# Altium schematic sheet AC_sch.SchDoc
size A; Organization: ORGANIZATION; Address1: ADDRESS 1; Address2: ADDRESS 2; Address3: ADDRESS 3; Address4: ADDRESS 4; Revision: -; SheetNumber: 2; SheetTotal: 2; ENG_APP_DATE: --/--/--; DSN_APP_DATE: --/--/--; CHK_APP_DATE: --/--/--
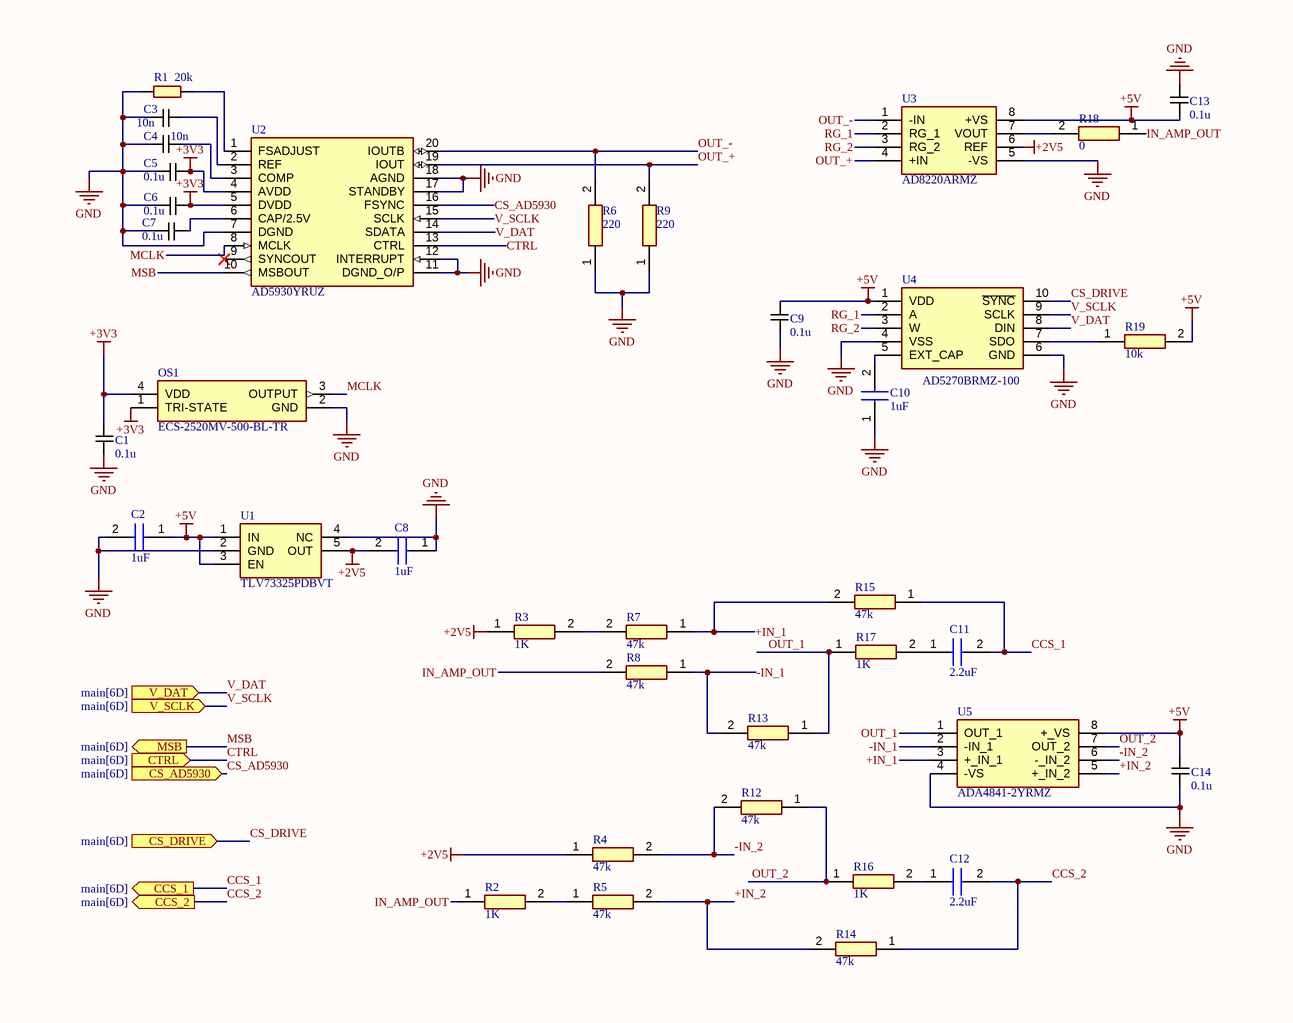
[diagram p0: AC_sch.SchDoc]

## Parts
C1  0.1u  [CAPC1005X55N]
C2  1uF  [CAPC1005X55N]
C3  10n  [CAPC1005X55N]
C4  10n  [CAPC1005X55N]
C5  0.1u  [CAPC1005X55N]
C6  0.1u  [CAPC1005X55N]
C7  0.1u  [CAPC1005X55N]
C8  1uF  [CAPC1005X55N]
C9  0.1u  [CAPC1005X55N]
C10  1uF  [CAPC1005X55N]
C11  2.2uF  [CAPC1005X57N]
C12  2.2uF  [CAPC1005X57N]
C13  0.1u  [CAPC1005X55N]
C14  0.1u  [CAPC1005X55N]
OS1  ECS-2520MV-500-BL-TR  [ECS2520MV500BLTR]
R1  20k  [RESC1005X40N]
R2  1K  [RESC1005X40N]
R3  1K  [RESC1005X40N]
R4  47k  [RESC1608X55N]
R5  47k  [RESC1608X55N]
R6  220  [RESC1005X40N]
R7  47k  [RESC1608X55N]
R8  47k  [RESC1608X55N]
R9  220  [RESC1005X40N]
R12  47k  [RESC1608X55N]
R13  47k  [RESC1608X55N]
R14  47k  [RESC1608X55N]
R15  47k  [RESC1608X55N]
R16  1K  [RESC1005X40N]
R17  1K  [RESC1005X40N]
R18  0  [RESC2012X65N]
R19  10k  [RESC1005X40N]
U1  TLV73325PDBVT  [SOT95P280X145-5N]
U2  AD5930YRUZ  [SOP65P640X120-20N]
U3  AD8220ARMZ  [SOP65P490X110-8N]
U4  AD5270BRMZ-100  [SOP50P490X110-10N]
U5  ADA4841-2YRMZ  [SOP65P490X110-8N]

## Ports
CCS_1 (out, see main[6D]), CCS_2 (out, see main[6D]), CS_AD5930 (in, see main[6D]), CS_DRIVE (in, see main[6D]), CTRL (in, see main[6D]), MSB (out, see main[6D]), V_DAT (in, see main[6D]), V_SCLK (in, see main[6D])

## Nets
+2V5: C8.2 R3.1 R4.1 U1.5(OUT) U3.6(REF)
+3V3: C1.2 C5.2 C6.2 OS1.1(TRI-STATE) OS1.4(VDD) U2.4(AVDD) U2.5(DVDD)
+5V: C2.1 C9.1 C13.2 C14.2 R19.2 U1.1(IN) U1.3(EN) U3.8(+VS) U4.1(VDD) U5.8(+_VS)
GND: C1.1 C2.2 C3.1 C4.2 C5.1 C6.1 C7.1 C8.1 C9.2 C10.1 C13.1 C14.1 OS1.2(GND) R1.1 R6.1 R9.1 U1.2(GND) U1.4(NC) U2.7(DGND) U2.11(DGND_O/P) U2.12(INTERRUPT) U2.17(STANDBY) U2.18(AGND) U3.5(-VS) U4.4(VSS) U4.6(GND) U5.4(-VS)
+IN_1: R7.1 R15.2 U5.3(+_IN_1)
+IN_2: R5.2 R14.2 U5.5(+_IN_2)
-IN_1: R8.1 R13.2 U5.2(-IN_1)
-IN_2: R4.2 R12.2 U5.6(-_IN_2)
CCS_1: C11.2 R15.1 ; port CCS_1
CCS_2: C12.2 R14.1 ; port CCS_2
CS_AD5930: U2.16(FSYNC) ; port CS_AD5930
CS_DRIVE: U4.10(~{SYNC}) ; port CS_DRIVE
CTRL: U2.13(CTRL) ; port CTRL
IN_AMP_OUT: R2.1 R8.2 R18.1
MCLK: OS1.3(OUTPUT) U2.8(MCLK)
MSB: U2.10(MSBOUT) ; port MSB
OUT_1: R13.1 R17.1 U5.1(OUT_1)
OUT_2: R12.1 R16.1 U5.7(OUT_2)
OUT_+: R9.2 U2.19(IOUT) U3.4(+IN)
OUT_-: R6.2 U2.20(IOUTB) U3.1(-IN)
RG_1: U3.2(RG_1) U4.2(A)
RG_2: U3.3(RG_2) U4.3(W)
V_DAT: U2.14(SDATA) U4.8(DIN) ; port V_DAT
V_SCLK: U2.15(SCLK) U4.9(SCLK) ; port V_SCLK
NetC3_2: C3.2 U2.2(REF)
NetC4_1: C4.1 U2.3(COMP)
NetC7_2: C7.2 U2.6(CAP/2.5V)
NetC10_2: C10.2 U4.5(EXT_CAP)
NetC11_1: C11.1 R17.2
NetC12_1: C12.1 R16.2
NetR1_2: R1.2 U2.1(FSADJUST)
NetR2_2: R2.2 R5.1
NetR3_2: R3.2 R7.2
NetR18_2: R18.2 U3.7(VOUT)
NetR19_1: R19.1 U4.7(SDO)

Not connected (* = marked no-connect by the designer): U2 9(SYNCOUT)*

## Notes on the sheet
- DWG. NO.
- REV.
- SHT.
- THIS DOCUMENT AND THE DATA DISCLOSED HEREIN OR HEREWITH IS THE PROPERTY OF ALTIUM LIMITED AND MAY BE FREELY DISTRIBUTED IN WHOLE. NO RIGHTS ARE RESERVED OR EXPRESS OR IMPLIED WARANTEE GIVEN.
- REVISION
- DESCRIPTION
- DATE
- APPROVED
- ENG:
- APPROVALS
- PROJECT
- DSN:
- CHK:
- REFERENCE DOCUMENTS
- PROJECT REVISION:
- TITLE
- DOCUMENT REVISION:
- DESIGN ITEM:
- BOM:
- FAB DWG:
- PCB DWG:
- ASSY DWG:
- SCALE:
- SIZE
- B
- CAGE CODE
- FILE NAME
- DWG NO.
- SHEET
- OF
- REV

## Library data of the parts
C1 C5-C7 C9 C13 C14 = CL05B104KO5NNNC: Capacitor; Manufacturer_Name: SAMSUNG; Datasheet Link: https://datasheet.datasheetarchive.com/originals/distributors/Datasheets-DGA10/2408147.pdf; Height: 0.55mm; Manufacturer_Part_Number: CL05B104KO5NNNC; Mouser Part Number: 187-CL05B104KO5NNNC; Mouser Price/Stock: https://www.mouser.co.uk/ProductDetail/Samsung-Electro-Mechanics/CL05B104KO5NNNC?qs=hqM3L16%252BxlfT2SKOuAUq6Q%3D%3D; Arrow Part Number: CL05B104KO5NNNC; Arrow Price/Stock: https://www.arrow.com/en/products/cl05b104ko5nnnc/samsung-electro-mechanics?utm_currency=USD&region=nac
C2 C8 C10 = CL05A105KP5NNNC: Capacitor; Manufacturer_Name: SAMSUNG; Datasheet Link: https://www.arrow.com/en/products/cl05a105kp5nnnc/samsung-electro-mechanics; Height: 0.55mm; Manufacturer_Part_Number: CL05A105KP5NNNC; Mouser Part Number: 187-CL05A105KP5NNNC; Mouser Price/Stock: https://www.mouser.co.uk/ProductDetail/Samsung-Electro-Mechanics/CL05A105KP5NNNC?qs=X6jEic%2FHinBsUeNeR9HD7w%3D%3D; Arrow Part Number: CL05A105KP5NNNC; Arrow Price/Stock: https://www.arrow.com/en/products/cl05a105kp5nnnc/samsung-electro-mechanics?region=nac
C3 C4 = CL05B103KB5NNNC: Capacitor; Manufacturer_Name: SAMSUNG; Datasheet Link: https://datasheet.datasheetarchive.com/originals/distributors/Datasheets-DGA10/2407958.pdf; Height: 0.55mm; Manufacturer_Part_Number: CL05B103KB5NNNC; Mouser Part Number: 187-CL05B103KB5NNNC; Mouser Price/Stock: https://www.mouser.co.uk/ProductDetail/Samsung-Electro-Mechanics/CL05B103KB5NNNC?qs=349EhDEZ59pcaIbMQHo3bQ%3D%3D; Arrow Part Number: CL05B103KB5NNNC; Arrow Price/Stock: https://www.arrow.com/en/products/cl05b103kb5nnnc/samsung-electro-mechanics?utm_currency=USD&region=nac
C11 C12 = CL05A225MQ5NSNC: Capacitor; Manufacturer_Name: SAMSUNG; Datasheet Link: https://datasheet.datasheetarchive.com/originals/dk/DKDS-19/372932.pdf; Height: 0.57mm; Manufacturer_Part_Number: CL05A225MQ5NSNC; Mouser Part Number: 187-CL05A225MQ5NSNC; Mouser Price/Stock: https://www.mouser.co.uk/ProductDetail/Samsung-Electro-Mechanics/CL05A225MQ5NSNC?qs=X6jEic%2FHinC0eBcvtpjFyQ%3D%3D; Arrow Part Number: CL05A225MQ5NSNC; Arrow Price/Stock: https://www.arrow.com/en/products/cl05a225mq5nsnc/samsung-electro-mechanics?utm_currency=USD&region=nac
OS1 = ECS-2520MV-500-BL-TR: Crystal or Oscillator; Manufacturer_Name: ECS; Datasheet Link: https://ecsxtal.com/store/pdf/ECS-2520MV.pdf; Height: 0.9mm; Manufacturer_Part_Number: ECS-2520MV-500-BL-TR; Mouser Part Number: 520-2520MV-500-BL-TR; Mouser Price/Stock: https://www.mouser.co.uk/ProductDetail/ECS/ECS-2520MV-500-BL-TR?qs=DRkmTr78QARre2%252BXmq63mg%3D%3D; Arrow Part Number: ECS-2520MV-500-BL-TR; Arrow Price/Stock: https://www.arrow.com/en/products/ecs-2520mv-500-bl-tr/ecs-international?region=nac
R1 = RC0402FR0720KL: Resistor; Manufacturer_Name: KEMET; Datasheet Link: http://www.yageo.com/documents/recent/PYu-RC0402_51_RoHS_L_6_r.pdf; Height: 0.4mm; Manufacturer_Part_Number: RC0402FR0720KL; Arrow Part Number: RC0402FR0720KL; Arrow Price/Stock: https://www.arrow.com/en/products/rc0402fr-0720kl/yageo
R2 R3 R16 R17 = 0402WGF1001TCE: Resistor; Manufacturer_Name: UNI-ROYAL(Uniroyal Elec); Datasheet Link: https://datasheet.lcsc.com/szlcsc/Uniroyal-Elec-0402WGF1001TCE_C11702.pdf; Height: 0.4mm; Manufacturer_Part_Number: 0402WGF1001TCE
R4 R5 R7 R8 R12-R15 = 0603WAF4702T5E: Resistor; Manufacturer_Name: UNI-ROYAL(Uniroyal Elec); Datasheet Link: https://datasheet.lcsc.com/szlcsc/Uniroyal-Elec-0603WAF4702T5E_C25819.pdf; Height: 0.55mm; Manufacturer_Part_Number: 0603WAF4702T5E
R6 R9 = 0402WGF2200TCE: Resistor; Manufacturer_Name: ROYALOHM; Datasheet Link: https://www2.mouser.com/datasheet/2/1365/1-3044649.pdf; Height: 0.4mm; Manufacturer_Part_Number: 0402WGF2200TCE; Mouser Part Number: 303-0402WGF2200TCE; Mouser Price/Stock: https://www.mouser.co.uk/ProductDetail/Royalohm/0402WGF2200TCE?qs=e8oIoAS2J1RP9vRYNvZ%252BDQ%3D%3D
R18 = CPF0805B10RE1: Resistor; Manufacturer_Name: TE Connectivity; Datasheet Link: http://docs-europe.electrocomponents.com/webdocs/13d1/0900766b813d116f.pdf; Height: 0.65mm; Manufacturer_Part_Number: CPF0805B10RE1; Mouser Part Number: 279-CPF0805B10RE1; Mouser Price/Stock: https://www.mouser.co.uk/ProductDetail/TE-Connectivity-Holsworthy/CPF0805B10RE1?qs=qj6TO2nKJqjxTen6wABuaQ%3D%3D; Arrow Part Number: CPF0805B10RE1; Arrow Price/Stock: https://www.arrow.com/en/products/cpf0805b10re1/te-connectivity?region=nac
R19 = RC0402JR-0710KL: Resistor; Manufacturer_Name: YAGEO; Datasheet Link: https://www.yageo.com/upload/media/product/productsearch/datasheet/rchip/PYu-RC_Group_51_RoHS_L_12.pdf; Height: 0.4mm; Manufacturer_Part_Number: RC0402JR-0710KL; Mouser Part Number: 603-RC0402JR-0710KL; Mouser Price/Stock: https://www.mouser.co.uk/ProductDetail/YAGEO/RC0402JR-0710KL?qs=V1yeUXFNrkk4BhFptVo0Rw%3D%3D; Arrow Part Number: RC0402JR-0710KL; Arrow Price/Stock: https://www.arrow.com/en/products/rc0402jr-0710kl/yageo?region=nac
U1 = TLV73325PDBVT: Integrated Circuit; Manufacturer_Name: Texas Instruments; Datasheet Link: http://www.ti.com/lit/gpn/TLV733P; Height: 1.45mm; Manufacturer_Part_Number: TLV73325PDBVT; Mouser Part Number: 595-TLV73325PDBVT; Mouser Price/Stock: https://www.mouser.co.uk/ProductDetail/Texas-Instruments/TLV73325PDBVT?qs=ifm8N2KdrcboKl2OgYRRdw%3D%3D; Arrow Part Number: TLV73325PDBVT; Arrow Price/Stock: https://www.arrow.com/en/products/tlv73325pdbvt/texas-instruments
U2 = AD5930YRUZ: Integrated Circuit; Manufacturer_Name: Analog Devices; Datasheet Link: https://datasheet.datasheetarchive.com/originals/distributors/Datasheets-4/DSA-67194.pdf; Height: 1.2mm; Manufacturer_Part_Number: AD5930YRUZ; Mouser Part Number: 584-AD5930YRUZ; Mouser Price/Stock: https://www.mouser.co.uk/ProductDetail/Analog-Devices/AD5930YRUZ?qs=NmRFExCfTkFA5qWdGRGhzQ%3D%3D; Arrow Part Number: AD5930YRUZ; Arrow Price/Stock: https://www.arrow.com/en/products/ad5930yruz/analog-devices?region=nac
U3 = AD8220ARMZ: Integrated Circuit; Manufacturer_Name: Analog Devices; Datasheet Link: http://www.analog.com/static/imported-files/data_sheets/AD8220.pdf; Height: 1.1mm; Manufacturer_Part_Number: AD8220ARMZ; Mouser Part Number: 584-AD8220ARMZ; Mouser Price/Stock: https://www.mouser.co.uk/ProductDetail/Analog-Devices/AD8220ARMZ?qs=%2FtpEQrCGXCySRYIeTivM6A%3D%3D; Arrow Part Number: AD8220ARMZ; Arrow Price/Stock: https://www.arrow.com/en/products/ad8220armz/analog-devices?utm_currency=USD&region=europe
U4 = AD5270BRMZ-100: Integrated Circuit; Manufacturer_Name: Analog Devices; Datasheet Link: https://www.analog.com/media/en/technical-documentation/data-sheets/ad5270_5271.pdf; Height: 1.1mm; Manufacturer_Part_Number: AD5270BRMZ-100; Mouser Part Number: 584-AD5270BRMZ-100; Mouser Price/Stock: https://www.mouser.co.uk/ProductDetail/Analog-Devices/AD5270BRMZ-100?qs=NmRFExCfTkFpgTn7ufWp4w%3D%3D; Arrow Part Number: AD5270BRMZ-100; Arrow Price/Stock: https://www.arrow.com/en/products/ad5270brmz-100/analog-devices?region=europe
U5 = ADA4841-2YRMZ: Integrated Circuit; Manufacturer_Name: Analog Devices; Datasheet Link: https://datasheet.datasheetarchive.com/originals/distributors/Datasheets-SFU1/DSASFU10004447.pdf; Height: 1.1mm; Manufacturer_Part_Number: ADA4841-2YRMZ; Mouser Part Number: 584-ADA4841-2YRMZ; Mouser Price/Stock: https://www.mouser.co.uk/ProductDetail/Analog-Devices/ADA4841-2YRMZ?qs=BpaRKvA4VqEiAK4J4giIjQ%3D%3D; Arrow Part Number: ADA4841-2YRMZ; Arrow Price/Stock: https://www.arrow.com/en/products/ada4841-2yrmz/analog-devices?utm_currency=USD&region=nac